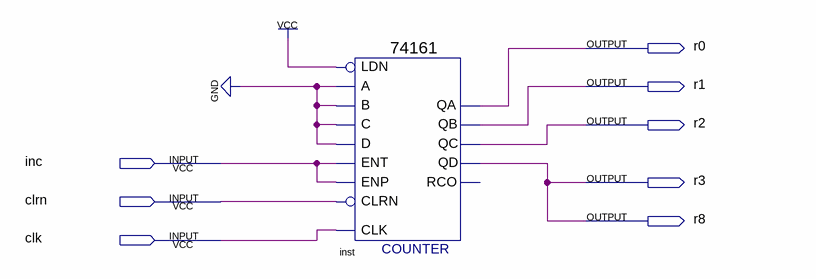
[diagram p0: schematic sheet]
// Quartus schematic contador.bdf as structural Verilog: 1 symbols, 8 pins
module contador (
  input  inc,
  input  clrn,
  input  clk,
  output r0,
  output r1,
  output r2,
  output r3,
  output r8
);

  \74161  inst (
    .CLRN(clrn), .CLK(clk), .ENP(inc), .LDN(1'b1), .A(1'b0), .D(1'b0), .ENT(inc), .B(1'b0), .C(1'b0),
    .QD(r3), .QC(r2), .QB(r1), .QA(r0));  // open: RCO

  assign r8 = r3;
endmodule
